# EAGLE schematic NanoBot-REV2 (EAGLE 9.6.2)

## Sheet 1 of 3
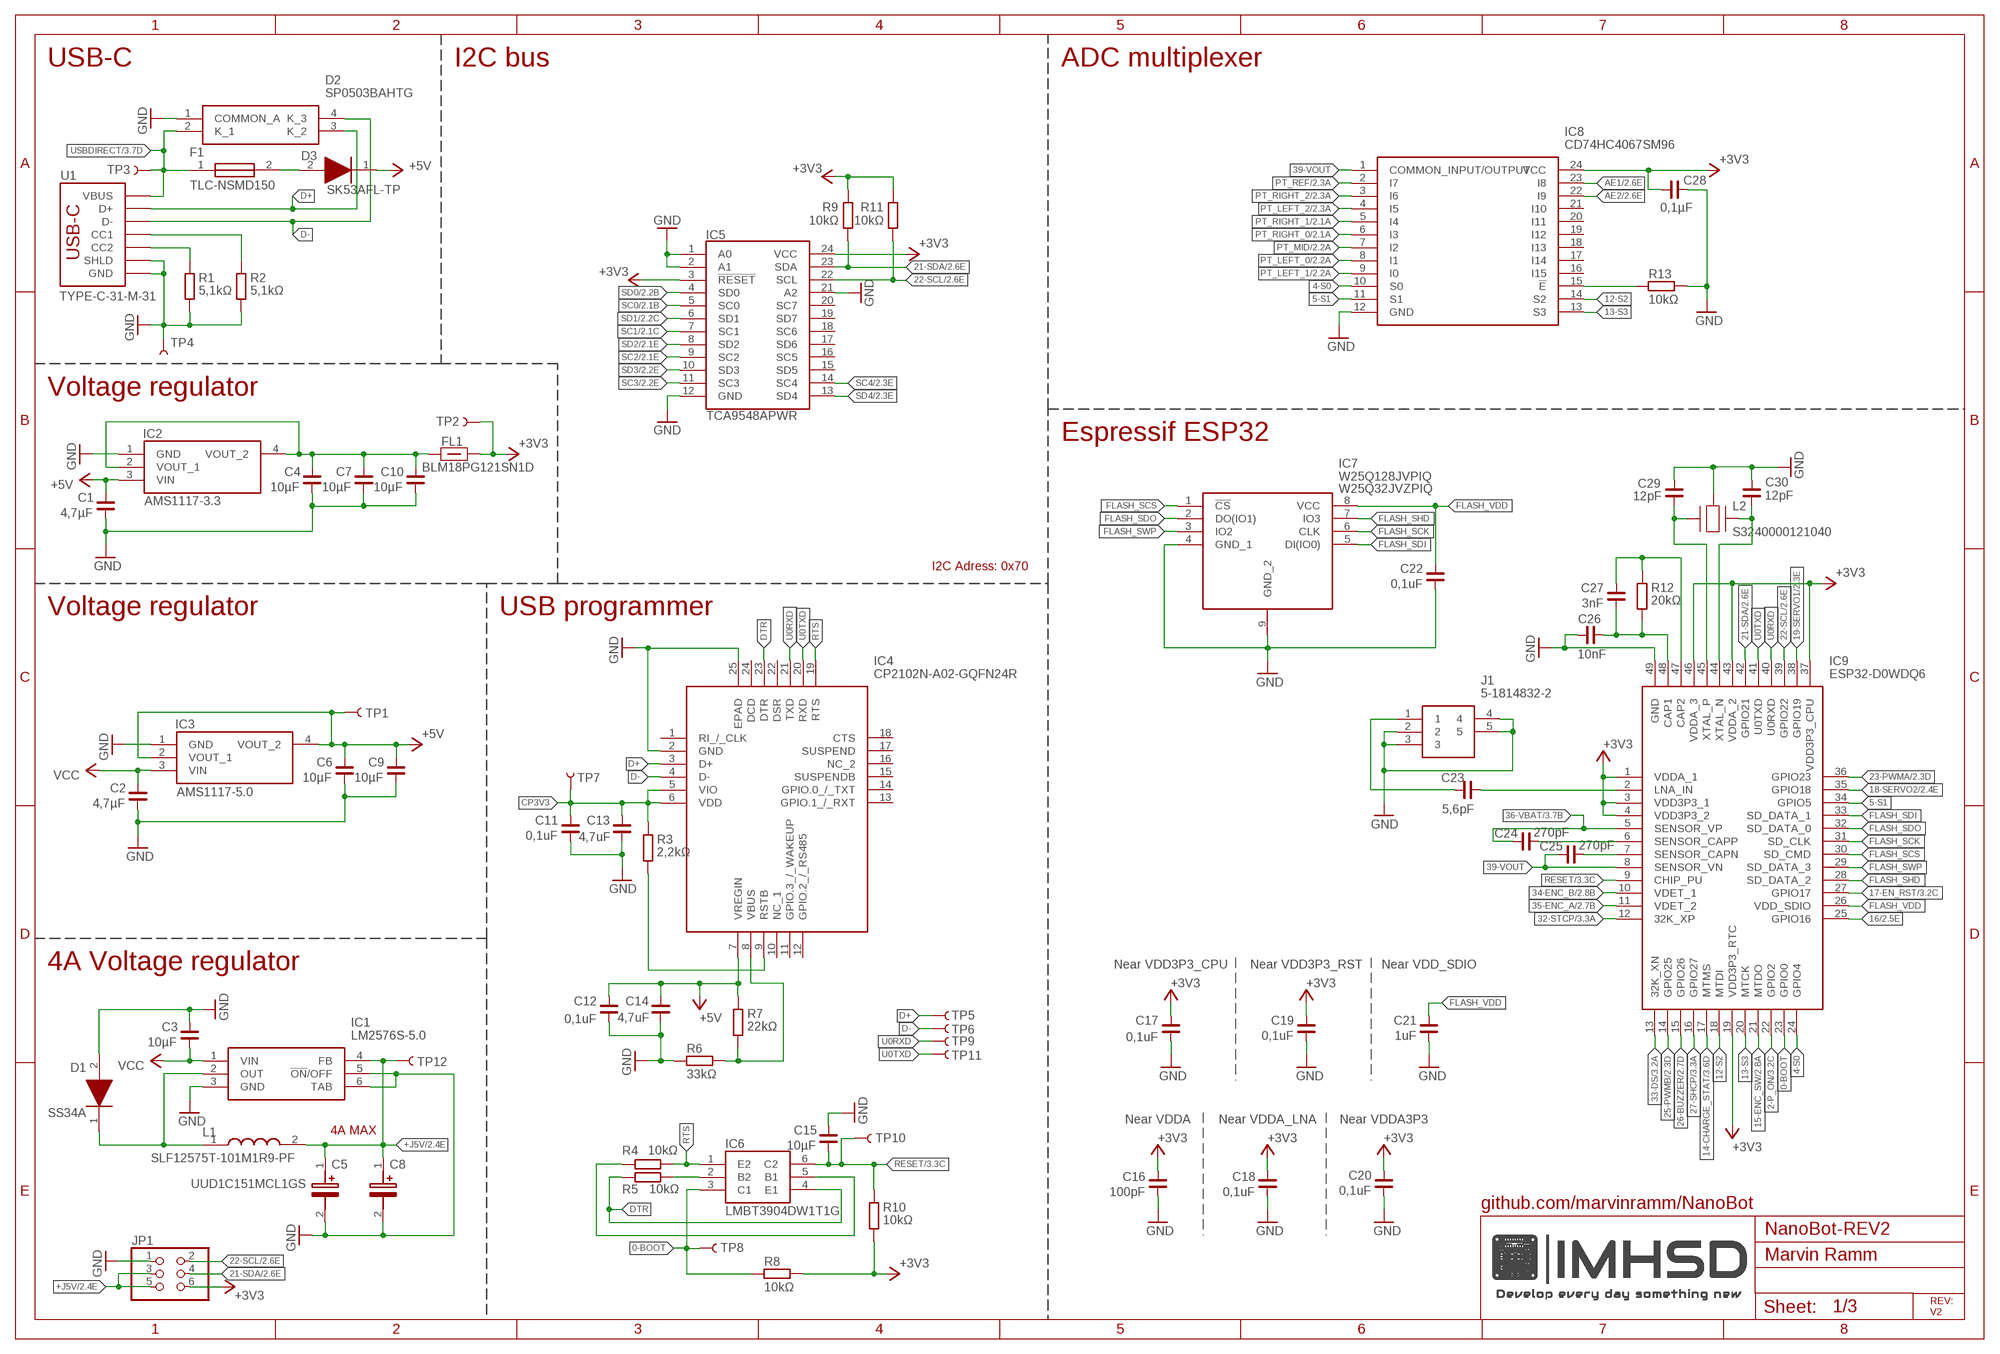
[diagram p0: schematic, sheet 1]

### Parts
C1  4,7µF  C_0603  [C0603]
C2  4,7µF  C_0603  [C0603]
C3  10µF  C_0603  [C0603]
C4  10µF  C_0603  [C0603]
C5  UUD1C151MCL1GS  [CAPAE660X800N]
C6  10µF  C_0603  [C0603]
C7  10µF  C_0603  [C0603]
C8  UUD1C151MCL1GS  [CAPAE660X800N]
C9  10µF  C_0603  [C0603]
C10  10µF  C_0603  [C0603]
C11  0,1uF  C_0402  [C0402]
C12  0,1uF  C_0402  [C0402]
C13  4,7uF  C_0402  [C0402]
C14  4,7uF  C_0402  [C0402]
C15  10µF  C_0603  [C0603]
C16  100pF  C_0402  [C0402]
C17  0,1uF  C_0402  [C0402]
C18  0,1uF  C_0402  [C0402]
C19  0,1uF  C_0402  [C0402]
C20  0,1uF  C_0402  [C0402]
C21  1uF  C_0402  [C0402]
C22  0,1uF  C_0402  [C0402]
C23  5,6pF  C_0402  [C0402]
C24  270pF  C_0402  [C0402]
C25  270pF  C_0402  [C0402]
C26  10nF  C_0402  [C0402]
C27  3nF  C_0402  [C0402]
C28  0,1µF  C_0402  [C0402]
C29  12pF  C_0402  [C0402]
C30  12pF  C_0402  [C0402]
D1  SS34A  [DIOM5026X262N]
D2  SP0503BAHTG  [SP0503BAHTG]
D3  SK53AFL-TP  [SODFL5026X120N]
F1  NANOSMDC020F-2  [FUSC3216X82N]
FL1  BLM18PG121SN1D  [BLM18AG102BH1D]
IC1  LM2576S-5.0  [KTT0005B]
IC2  AMS1117-3.3  [SOT229P700X180-4N]
IC3  AMS1117-3.3  [SOT229P700X180-4N]
IC4  CP2102N-A02-GQFN24R  [QFN50P400X400X80-25N]
IC5  TCA9548APWR  [SOP65P640X120-24N]
IC6  MMDT3904-TP  [SOT65P230X120-6N]
IC7  W25Q128JVPIQ  [SON127P800X600X80-9N]
IC8  CD74HC4067SM96  [SOP65P780X200-24N]
IC9  ESP32-D0WDQ6  [QFN40P600X600X90-49N]
J1  5-1814832-2  [518148322]
JP1  PINHD-2X3  [2X03]
L1  SLF12575T-101M1R9-PF  [SLF12575]
L2  SMD-3225_4P16MHZ_20PF_10PPM_-4  [SMD3225_4P16MHZ20PF10PPM4085]
R1  5,1kΩ  R_0402  [R0402]
R2  5,1kΩ  R_0402  [R0402]
R3  2,2kΩ  R_0402  [R0402]
R4  10kΩ  R_0402  [R0402]
R5  10kΩ  R_0402  [R0402]
R6  33kΩ  R_0402  [R0402]
R7  22kΩ  R_0402  [R0402]
R8  10kΩ  R_0402  [R0402]
R9  10kΩ  R_0402  [R0402]
R10  10kΩ  R_0402  [R0402]
R11  10kΩ  R_0402  [R0402]
R12  20kΩ  R_0402  [R0402]
R13  10kΩ  R_0402  [R0402]
TP1  TEST-POINT3X5  [PAD.03X.05]
TP2  TEST-POINT3X5  [PAD.03X.05]
TP3  TEST-POINT3X5  [PAD.03X.05]
TP4  TEST-POINT3X5  [PAD.03X.05]
TP5  TEST-POINT3X5  [PAD.03X.05]
TP6  TEST-POINT3X5  [PAD.03X.05]
TP7  TEST-POINT3X5  [PAD.03X.05]
TP8  TEST-POINT3X5  [PAD.03X.05]
TP9  TEST-POINT3X5  [PAD.03X.05]
TP10  TEST-POINT3X5  [PAD.03X.05]
TP11  TEST-POINT3X5  [PAD.03X.05]
TP12  TEST-POINT3X5  [PAD.03X.05]
U1  TYPE-C-31-M-14  [TYPE-C-31-M-14_HRO]

### Nets
0-BOOT: IC6.3(C1) IC9.23(GPIO0) R8.2 TP8.1
2-P_ON: IC9.22(GPIO2) ; also sheet 3
4-S0: IC8.10(S0) IC9.24(GPIO4)
5-S1: IC8.11(S1) IC9.34(GPIO5)
12-S2: IC8.14(S2) IC9.18(MTDI)
13-S3: IC8.13(S3) IC9.20(MTCK)
14-CHARGE_STAT: IC9.17(MTMS) ; also sheet 3
15-ENC_SW: IC9.21(MTDO) ; also sheet 2
16: IC9.25(GPIO16) ; also sheet 2
17-EN_RST: IC9.27(GPIO17) ; also sheet 3
18-SERVO2: IC9.35(GPIO18) ; also sheet 2
19-SERVO1: IC9.38(GPIO19) ; also sheet 2
21-SDA: IC5.23(SDA) IC9.42(GPIO21) JP1.4 R9.1 ; also sheet 2
22-SCL: IC5.22(SCL) IC9.39(GPIO22) JP1.2 R11.1 ; also sheet 2
23-PWMA: IC9.36(GPIO23) ; also sheet 2
25-PWMB: IC9.14(GPIO25) ; also sheet 2
26-BUZZER: IC9.15(GPIO26) ; also sheet 2
27-SHCP: IC9.16(GPIO27) ; also sheet 3
32-STCP: IC9.12(32K_XP) ; also sheet 3
33-DS: IC9.13(32K_XN) ; also sheet 3
34-ENC_B: IC9.10(VDET_1) ; also sheet 2
35-ENC_A: IC9.11(VDET_2) ; also sheet 2
36-VBAT: C24.1 IC9.5(SENSOR_VP) ; also sheet 3
39-VOUT: C25.1 IC8.1(COMMON_INPUT/OUTPUT) IC9.8(SENSOR_VN)
+3V3: C16.2 C17.2 C18.2 C19.2 C20.2 C28.1 FL1.1 IC5.3(!RESET) IC5.24(VCC) IC8.24(VCC) IC9.1(VDDA_1) IC9.3(VDD3P3_1) IC9.4(VDD3P3_2) IC9.19(VDD3P3_RTC) IC9.37(VDD3P3_CPU) IC9.43(VDDA_2) IC9.46(VDDA_3) JP1.6 R8.1 R9.2 R10.2 R11.2 TP2.1 ; also sheet 2,3
+5V: C1.1 C6.1 C9.1 C12.2 C14.2 D3.1(K) IC2.3(VIN) IC3.2(VOUT_1) IC3.4(VOUT_2) IC4.7(VREGIN) R7.1 TP1.1 ; also sheet 2,3
+J5V: C5.1(+) C8.1(+) IC1.4(FB) JP1.3 JP1.5 L1.2 TP12.1 ; also sheet 2
AE1: IC8.23(I8) ; also sheet 2
AE2: IC8.22(I9) ; also sheet 2
CP3V3: C11.2 C13.2 IC4.5(VIO) IC4.6(VDD) R3.1 TP7.1
D+: D2.3(K_2) IC4.3(D+) TP5.1 U1.A6(D+) U1.B6(D+)
D-: D2.4(K_3) IC4.4(D-) TP6.1 U1.A7(D-) U1.B7(D-)
DTR: IC4.23(DTR) IC6.4(E1) R5.2
FLASH_SCK: IC7.6(CLK) IC9.31(SD_CLK)
FLASH_SCS: IC7.1(!CS) IC9.30(SD_CMD)
FLASH_SDI: IC7.5(DI(IO0)) IC9.33(SD_DATA_1)
FLASH_SDO: IC7.2(DO(IO1)) IC9.32(SD_DATA_0)
FLASH_SHD: IC7.7(IO3) IC9.28(SD_DATA_2)
FLASH_SWP: IC7.3(IO2) IC9.29(SD_DATA_3)
FLASH_VDD: C21.2 C22.2 IC7.8(VCC) IC9.26(VDD_SDIO)
GND: C1.2 C2.2 C3.1 C4.2 C5.2(-) C6.2 C7.2 C8.2(-) C9.2 C10.2 C11.1 C12.1 C13.1 C14.1 C15.1 C16.1 C17.1 C18.1 C19.1 C20.1 C21.1 C22.1 C26.1 C28.2 C29.1 C30.1 D1.2(A) D2.1(COMMON_A) IC1.3(GND) IC1.5(!ON!/OFF) IC1.6(TAB) IC2.1(GND) IC3.1(GND) IC4.2(GND) IC4.25(EPAD) IC5.1(A0) IC5.2(A1) IC5.12(GND) IC5.21(A2) IC7.4(GND_1) IC7.9(GND_2) IC8.12(GND) IC9.49(GND) J1.2 J1.3 J1.4 J1.5 JP1.1 L2.2(GND_2) L2.4(GND_2) R1.2 R2.2 R6.2 R13.2 TP4.1 U1.A1B12(GND) U1.B1A12(GND) U1.P$1(SHLD) U1.P$2(SHLD) U1.P$3(SHLD) U1.P$4(SHLD) U1.P$5(SHLD) U1.P$6(SHLD) U1.P$7(SHLD) U1.P$8(SHLD) U1.P$9(SHLD) U1.P$10(SHLD) U1.P$11(SHLD) U1.P$12(SHLD) U1.P$14(SHLD) U1.P$16(SHLD) U1.P$18(SHLD) U1.P$20(SHLD) ; also sheet 2,3
N$9: C4.1 C7.1 C10.1 FL1.2 IC2.2(VOUT_1) IC2.4(VOUT_2)
N$10: R1.1 U1.B5(CC2)
N$11: R2.1 U1.A5(CC1)
N$12: IC4.9(RSTB) R3.2
N$13: IC4.8(VBUS) R6.1 R7.2
N$20: IC8.15(!E) R13.1
N$23: C23.1 IC9.2(LNA_IN)
N$24: C26.2 C27.1 IC9.48(CAP1) R12.2
N$25: C27.2 IC9.47(CAP2) R12.1
N$26: C30.2 IC9.44(XTAL_N) L2.3(CRYSTAL_2)
N$27: C29.2 IC9.45(XTAL_P) L2.1(CRYSTAL_1)
N$29: C23.2 J1.1
N$37: IC6.5(B1) R4.2
N$38: IC6.2(B2) R5.1
N$39: C25.2 IC9.7(SENSOR_CAPN)
N$40: D3.2(A) F1.2
N$41: C24.2 IC9.6(SENSOR_CAPP)
N$43: D1.1(K) IC1.2(OUT) L1.1
PT_LEFT_0: IC8.8(I1) ; also sheet 2
PT_LEFT_1: IC8.9(I0) ; also sheet 2
PT_LEFT_2: IC8.4(I5) ; also sheet 2
PT_MID: IC8.7(I2) ; also sheet 2
PT_REF: IC8.2(I7) ; also sheet 2
PT_RIGHT_0: IC8.6(I3) ; also sheet 2
PT_RIGHT_1: IC8.5(I4) ; also sheet 2
PT_RIGHT_2: IC8.3(I6) ; also sheet 2
RESET: C15.2 IC6.6(C2) IC9.9(CHIP_PU) R10.1 TP10.1 ; also sheet 3
RTS: IC4.19(RTS) IC6.1(E2) R4.1
SC0: IC5.5(SC0) ; also sheet 2
SC1: IC5.7(SC1) ; also sheet 2
SC2: IC5.9(SC2) ; also sheet 2
SC3: IC5.11(SC3) ; also sheet 2
SC4: IC5.14(SC4) ; also sheet 2
SD0: IC5.4(SD0) ; also sheet 2
SD1: IC5.6(SD1) ; also sheet 2
SD2: IC5.8(SD2) ; also sheet 2
SD3: IC5.10(SD3) ; also sheet 2
SD4: IC5.13(SD4) ; also sheet 2
U0RXD: IC4.21(TXD) IC9.40(U0RXD) TP9.1
U0TXD: IC4.20(RXD) IC9.41(U0TXD) TP11.1
USBDIRECT: D2.2(K_1) F1.1 TP3.1 U1.A4B9(VBUS) U1.B4A9(VBUS) ; also sheet 3
VCC: C2.1 C3.2 IC1.1(VIN) IC3.3(VIN) ; also sheet 2,3
Unconnected: IC4.1(RI_/_CLK) IC4.10(NC_1) IC4.11(GPIO.3_/_WAKEUP) IC4.12(GPIO.2_/_RS485) IC4.13(GPIO.1_/_RXT) IC4.14(GPIO.0_/_TXT) IC4.15(SUSPENDB) IC4.16(NC_2) IC4.17(SUSPEND) IC4.18(CTS) IC4.22(DSR) IC4.24(DCD) IC5.15(SD5) IC5.16(SC5) IC5.17(SD6) IC5.18(SC6) IC5.19(SD7) IC5.20(SC7) IC8.16(I15) IC8.17(I14) IC8.18(I13) IC8.19(I12) IC8.20(I11) IC8.21(I10)

### Notes on the sheet
- USB-C | I2C bus | ADC multiplexer
- TLC-NSMD150
- TYPE-C-31-M-31
- Voltage regulator
- Espressif ESP32
- W25Q32JVZPIQ
- S3240000121040
- I2C Adress: 0x70
- Voltage regulator | USB programmer
- AMS1117-5.0
- Near VDD3P3_CPU | Near VDD3P3_RST | Near VDD_SDIO
- 4A Voltage regulator
- Near VDDA | Near VDDA_LNA | Near VDDA3P3
- 4A MAX
- LMBT3904DW1T1G | github.com/marvinramm/NanoBot
- Marvin Ramm
- REV:
  V2

## Sheet 2 of 3
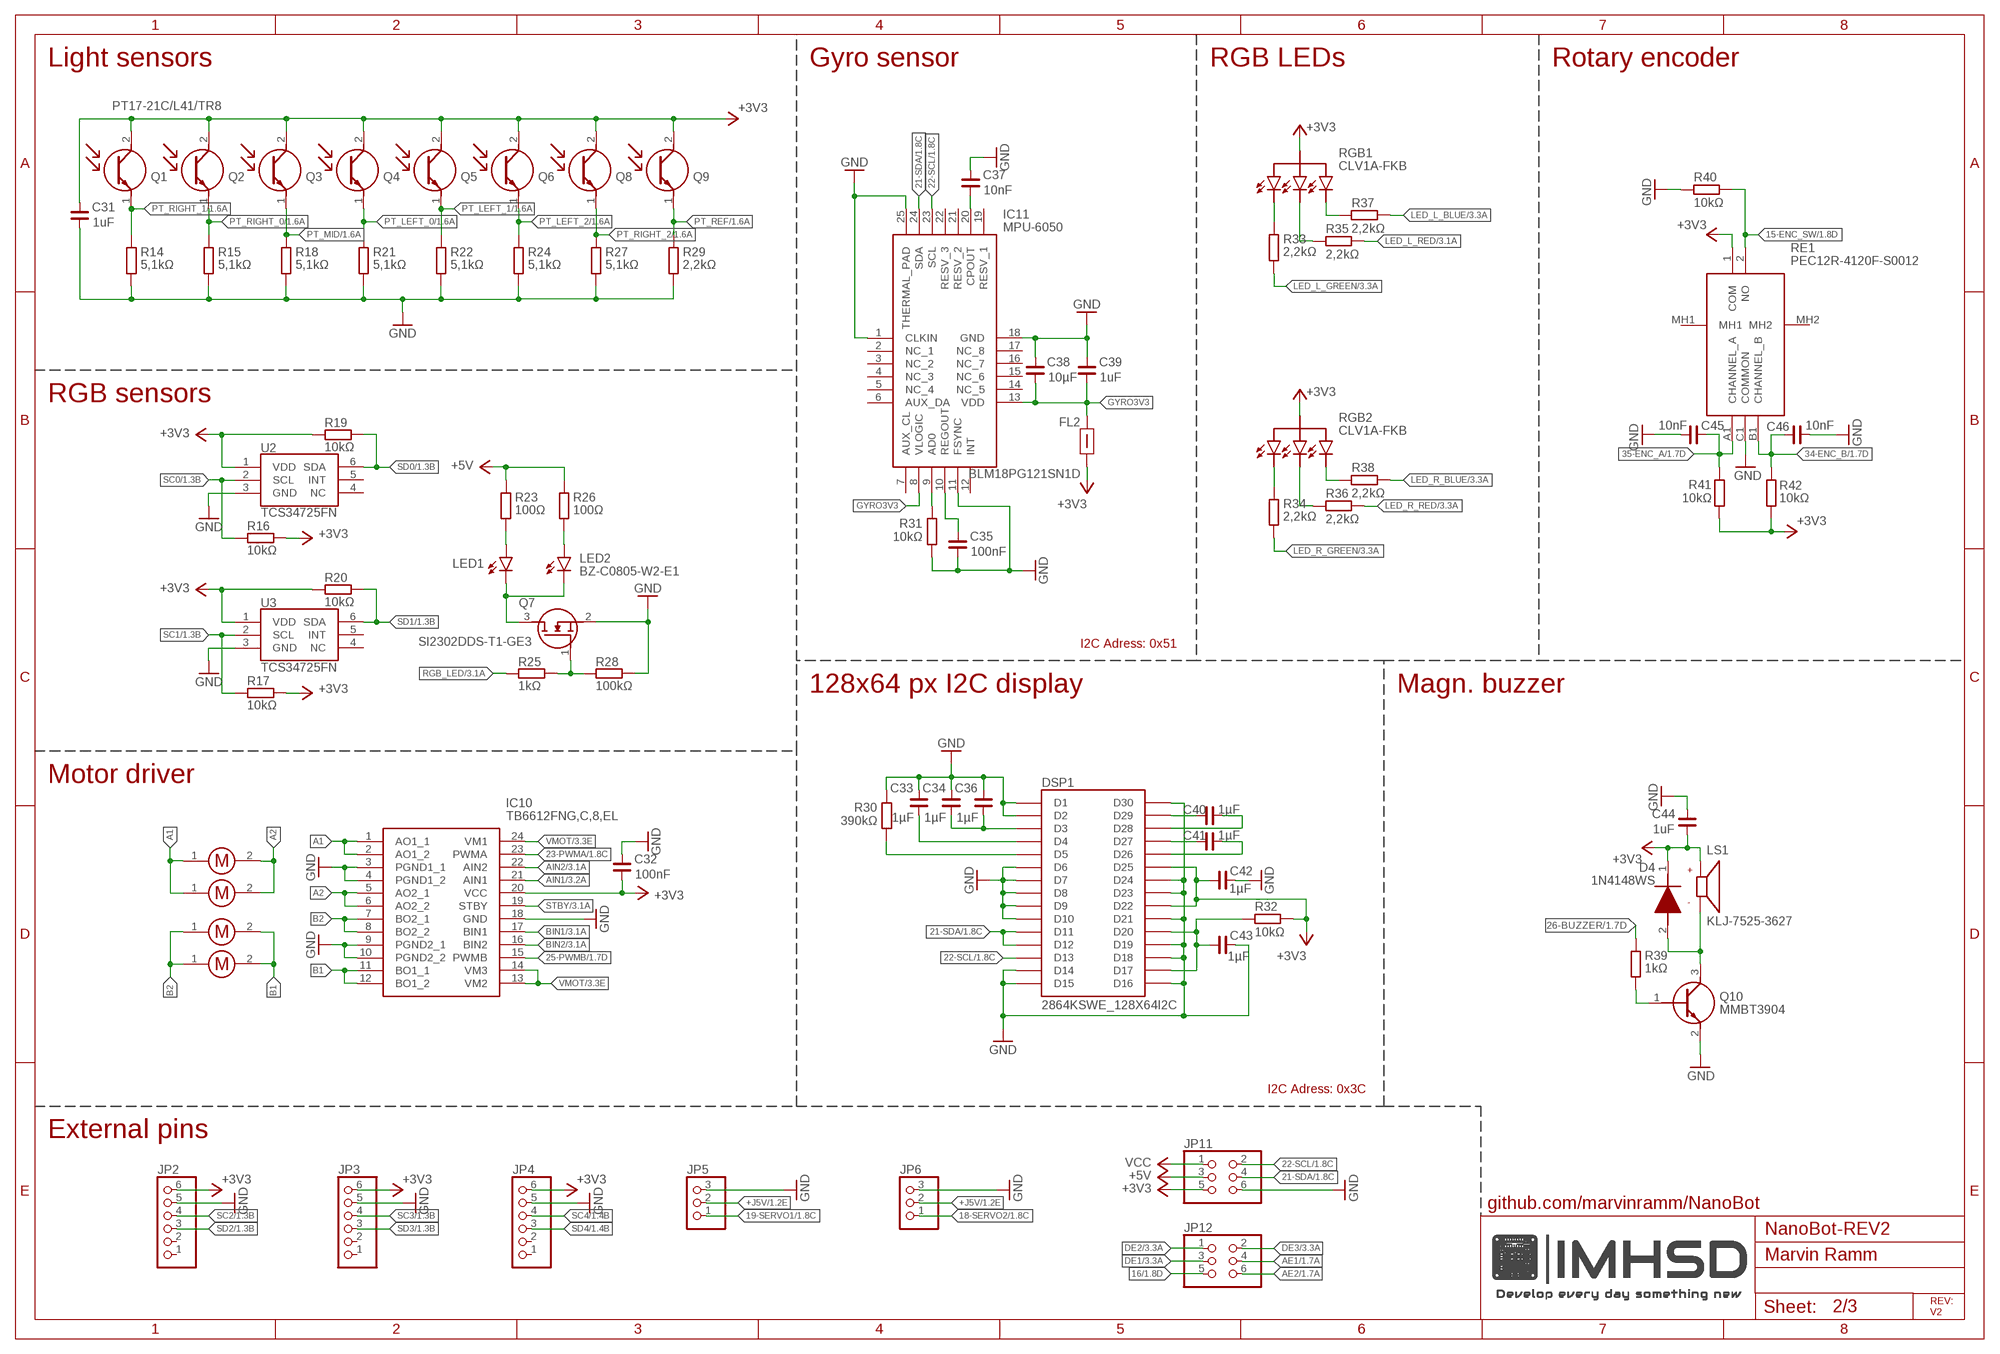
[diagram p1: schematic, sheet 2]

### Parts
C31  1uF  C_0402  [C0402]
C32  100nF  C_0402  [C0402]
C33  1µF  C_0402  [C0402]
C34  1µF  C_0402  [C0402]
C35  100nF  C_0402  [C0402]
C36  1µF  C_0402  [C0402]
C37  10nF  C_0402  [C0402]
C38  10µF  C_0603  [C0603]
C39  1uF  C_0402  [C0402]
C40  1µF  C_0402  [C0402]
C41  1µF  C_0402  [C0402]
C42  1µF  C_0402  [C0402]
C43  1µF  C_0402  [C0402]
C44  1uF  C_0402  [C0402]
C45  10nF  C_0402  [C0402]
C46  10nF  C_0402  [C0402]
D4  1N4148WS  [SODFL2512X90N]
DSP1  2864KSWE_128X64I2C  [2864KSWE_128X64I2C]
FL2  BLM18PG121SN1D  [BLM18AG102BH1D]
IC10  TB6612FNG,C,8,EL  [SOP65P760X160-24N]
IC11  MPU-6050  [QFN50P400X400X95-25N]
JP2  PINHD-1X6  [1X06]
JP3  PINHD-1X6  [1X06]
JP4  PINHD-1X6  [1X06]
JP5  PINHD-1X3  [1X03]
JP6  PINHD-1X3  [1X03]
JP11  PINHD-2X3  [2X03]
JP12  PINHD-2X3  [2X03]
LED1  LEDCHIP-LED0805  [CHIP-LED0805]
LED2  LEDCHIP-LED0805  [CHIP-LED0805]
LS1  CMT-7525-80-SMT-TR  [XDCR_CMT-7525-80-SMT-TR]
M1  MOTOR_30RPM  [MOTOR_30RPM]
M2  MOTOR_30RPM  [MOTOR_30RPM]
M3  MOTOR_30RPM  [MOTOR_30RPM]
M4  MOTOR_30RPM  [MOTOR_30RPM]
Q1  PT17-21C/L41/TR8  [0805]
Q2  PT17-21C/L41/TR8  [0805]
Q3  PT17-21C/L41/TR8  [0805]
Q4  PT17-21C/L41/TR8  [0805]
Q5  PT17-21C/L41/TR8  [0805]
Q6  PT17-21C/L41/TR8  [0805]
Q7  SI2302DDS-T1-GE3  [SOT95P237X112-3N]
Q8  PT17-21C/L41/TR8  [0805]
Q9  PT17-21C/L41/TR8  [0805]
Q10  MMBT3904  [SOT95P240X120-3N]
R14  5,1kΩ  R_0402  [R0402]
R15  5,1kΩ  R_0402  [R0402]
R16  10kΩ  R_0402  [R0402]
R17  10kΩ  R_0402  [R0402]
R18  5,1kΩ  R_0402  [R0402]
R19  10kΩ  R_0402  [R0402]
R20  10kΩ  R_0402  [R0402]
R21  5,1kΩ  R_0402  [R0402]
R22  5,1kΩ  R_0402  [R0402]
R23  100Ω  R_0402  [R0402]
R24  5,1kΩ  R_0402  [R0402]
R25  1kΩ  R_0402  [R0402]
R26  100Ω  R_0402  [R0402]
R27  5,1kΩ  R_0402  [R0402]
R28  100kΩ  R_0402  [R0402]
R29  2,2kΩ  R_0402  [R0402]
R30  390kΩ  R_0402  [R0402]
R31  10kΩ  R_0402  [R0402]
R32  10kΩ  R_0402  [R0402]
R33  2,2kΩ  R_0402  [R0402]
R34  2,2kΩ  R_0402  [R0402]
R35  2,2kΩ  R_0402  [R0402]
R36  2,2kΩ  R_0402  [R0402]
R37  2,2kΩ  R_0402  [R0402]
R38  2,2kΩ  R_0402  [R0402]
R39  1kΩ  R_0402  [R0402]
R40  10kΩ  R_0402  [R0402]
R41  10kΩ  R_0402  [R0402]
R42  10kΩ  R_0402  [R0402]
RE1  PEC12R-4230F-S0024  [PEC12R4230FS0024]
RGB1  RGBLED  [RGBLED]
RGB2  RGBLED  [RGBLED]
U2  TCS34725FN  [FN_1]
U3  TCS34725FN  [FN_1]

### Nets
15-ENC_SW: R40.2 RE1.2(NO) ; also sheet 1
16: JP12.5 ; also sheet 1
18-SERVO2: JP6.1 ; also sheet 1
19-SERVO1: JP5.1 ; also sheet 1
21-SDA: DSP1.D11 DSP1.D12 IC11.24(SDA) JP11.4 ; also sheet 1
22-SCL: DSP1.D13 IC11.23(SCL) JP11.2 ; also sheet 1
23-PWMA: IC10.23(PWMA) ; also sheet 1
25-PWMB: IC10.15(PWMB) ; also sheet 1
26-BUZZER: R39.1 ; also sheet 1
34-ENC_B: C46.1 R42.2 RE1.B1(CHANNEL_B) ; also sheet 1
35-ENC_A: C45.1 R41.2 RE1.A1(CHANNEL_A) ; also sheet 1
+3V3: C31.2 C32.1 C42.1 C44.1 D4.1(K) DSP1.D22 DSP1.D25 FL2.1 IC10.20(VCC) JP2.6 JP3.6 JP4.6 JP11.5 LS1.P Q1.2(C) Q2.2(C) Q3.2(C) Q4.2(C) Q5.2(C) Q6.2(C) Q8.2(C) Q9.2(C) R16.1 R17.1 R19.2 R20.2 R32.2 R41.1 R42.1 RE1.1(COM) RGB1.+5V RGB2.+5V U2.1(VDD) U3.1(VDD) ; also sheet 1,3
+5V: JP11.3 R23.1 R26.1 ; also sheet 1,3
+J5V: JP5.2 JP6.2 ; also sheet 1
A1: IC10.1(AO1_1) IC10.2(AO1_2) M1.1 M2.1
A2: IC10.5(AO2_1) IC10.6(AO2_2) M1.2 M2.2
AE1: JP12.4 ; also sheet 1
AE2: JP12.6 ; also sheet 1
AIN1: IC10.21(AIN1) ; also sheet 3
AIN2: IC10.22(AIN2) ; also sheet 3
B1: IC10.11(BO1_1) IC10.12(BO1_2) M3.2 M4.2
B2: IC10.7(BO2_1) IC10.8(BO2_2) M3.1 M4.1
BIN1: IC10.17(BIN1) ; also sheet 3
BIN2: IC10.16(BIN2) ; also sheet 3
DE1: JP12.3 ; also sheet 3
DE2: JP12.1 ; also sheet 3
DE3: JP12.2 ; also sheet 3
GND: C31.1 C32.2 C33.1 C34.1 C35.1 C36.1 C37.2 C38.1 C39.2 C42.2 C43.2 C44.2 C45.2 C46.2 DSP1.D1 DSP1.D2 DSP1.D6 DSP1.D7 DSP1.D8 DSP1.D9 DSP1.D10 DSP1.D14 DSP1.D15 DSP1.D16 DSP1.D18 DSP1.D19 DSP1.D21 DSP1.D23 DSP1.D24 DSP1.D30 IC10.3(PGND1_1) IC10.4(PGND1_2) IC10.9(PGND2_1) IC10.10(PGND2_2) IC10.18(GND) IC11.1(CLKIN) IC11.11(FSYNC) IC11.18(GND) IC11.25(THERMAL_PAD) JP2.5 JP3.5 JP4.5 JP5.3 JP6.3 JP11.6 Q7.2(S) Q10.2(E) R14.2 R15.2 R18.2 R21.2 R22.2 R24.2 R27.2 R28.2 R29.2 R30.2 R31.1 R40.1 RE1.C1(COMMON) U2.3(GND) U3.3(GND) ; also sheet 1,3
GYRO3V3: C38.2 C39.1 FL2.2 IC11.8(VLOGIC) IC11.13(VDD)
LED_L_BLUE: R37.2 ; also sheet 3
LED_L_GREEN: R33.2 ; also sheet 3
LED_L_RED: R35.2 ; also sheet 3
LED_R_BLUE: R38.2 ; also sheet 3
LED_R_GREEN: R34.2 ; also sheet 3
LED_R_RED: R36.2 ; also sheet 3
N$1: C37.1 IC11.20(CPOUT)
N$2: C35.2 IC11.10(REGOUT)
N$3: IC11.9(AD0) R31.2
N$5: LED1.A R23.2
N$6: LED2.A R26.2
N$7: LED1.C LED2.C Q7.3(D)
N$8: Q7.1(G) R25.2 R28.1
N$28: C41.1 DSP1.D27
N$30: C43.1 DSP1.D17 DSP1.D20 R32.1
N$31: C33.2 DSP1.D4
N$32: C41.2 DSP1.D26
N$33: C34.2 C36.2 DSP1.D3
N$34: DSP1.D5 R30.1
N$35: C40.1 DSP1.D29
N$36: C40.2 DSP1.D28
N$45: R33.1 RGB1.P3
N$46: R37.1 RGB1.P1
N$47: R35.1 RGB1.P2
N$50: R34.1 RGB2.P3
N$51: R38.1 RGB2.P1
N$52: R36.1 RGB2.P2
N$66: D4.2(A) LS1.N Q10.3(C)
N$69: Q10.1(B) R39.2
PT_LEFT_0: Q4.1(E) R21.1 ; also sheet 1
PT_LEFT_1: Q5.1(E) R22.1 ; also sheet 1
PT_LEFT_2: Q6.1(E) R24.1 ; also sheet 1
PT_MID: Q3.1(E) R18.1 ; also sheet 1
PT_REF: Q9.1(E) R29.1 ; also sheet 1
PT_RIGHT_0: Q2.1(E) R15.1 ; also sheet 1
PT_RIGHT_1: Q1.1(E) R14.1 ; also sheet 1
PT_RIGHT_2: Q8.1(E) R27.1 ; also sheet 1
RGB_LED: R25.1 ; also sheet 3
SC0: R16.2 U2.2(SCL) ; also sheet 1
SC1: R17.2 U3.2(SCL) ; also sheet 1
SC2: JP2.4 ; also sheet 1
SC3: JP3.4 ; also sheet 1
SC4: JP4.4 ; also sheet 1
SD0: R19.1 U2.6(SDA) ; also sheet 1
SD1: R20.1 U3.6(SDA) ; also sheet 1
SD2: JP2.3 ; also sheet 1
SD3: JP3.3 ; also sheet 1
SD4: JP4.3 ; also sheet 1
STBY: IC10.19(STBY) ; also sheet 3
VCC: JP11.1 ; also sheet 1,3
VMOT: IC10.13(VM2) IC10.14(VM3) IC10.24(VM1) ; also sheet 3
Unconnected: IC11.2(NC_1) IC11.3(NC_2) IC11.4(NC_3) IC11.5(NC_4) IC11.6(AUX_DA) IC11.7(AUX_CL) IC11.12(INT) IC11.14(NC_5) IC11.15(NC_6) IC11.16(NC_7) IC11.17(NC_8) IC11.19(RESV_1) IC11.21(RESV_2) IC11.22(RESV_3) JP2.1 JP2.2 JP3.1 JP3.2 JP4.1 JP4.2 RE1.MH1 RE1.MH2 U2.4(NC) U2.5(INT) U3.4(NC) U3.5(INT)

### Notes on the sheet
- Light sensors | Gyro sensor | RGB LEDs | Rotary encoder
- RGB1
- CLV1A-FKB
- PEC12R-4120F-S0012
- RGB sensors
- RGB2
- CLV1A-FKB
- BZ-C0805-W2-E1
- I2C Adress: 0x51
- 128x64 px I2C display | Magn. buzzer
- Motor driver
- KLJ-7525-3627
- I2C Adress: 0x3C
- External pins
- github.com/marvinramm/NanoBot
- JP12
- Marvin Ramm
- REV:
  V2

## Sheet 3 of 3
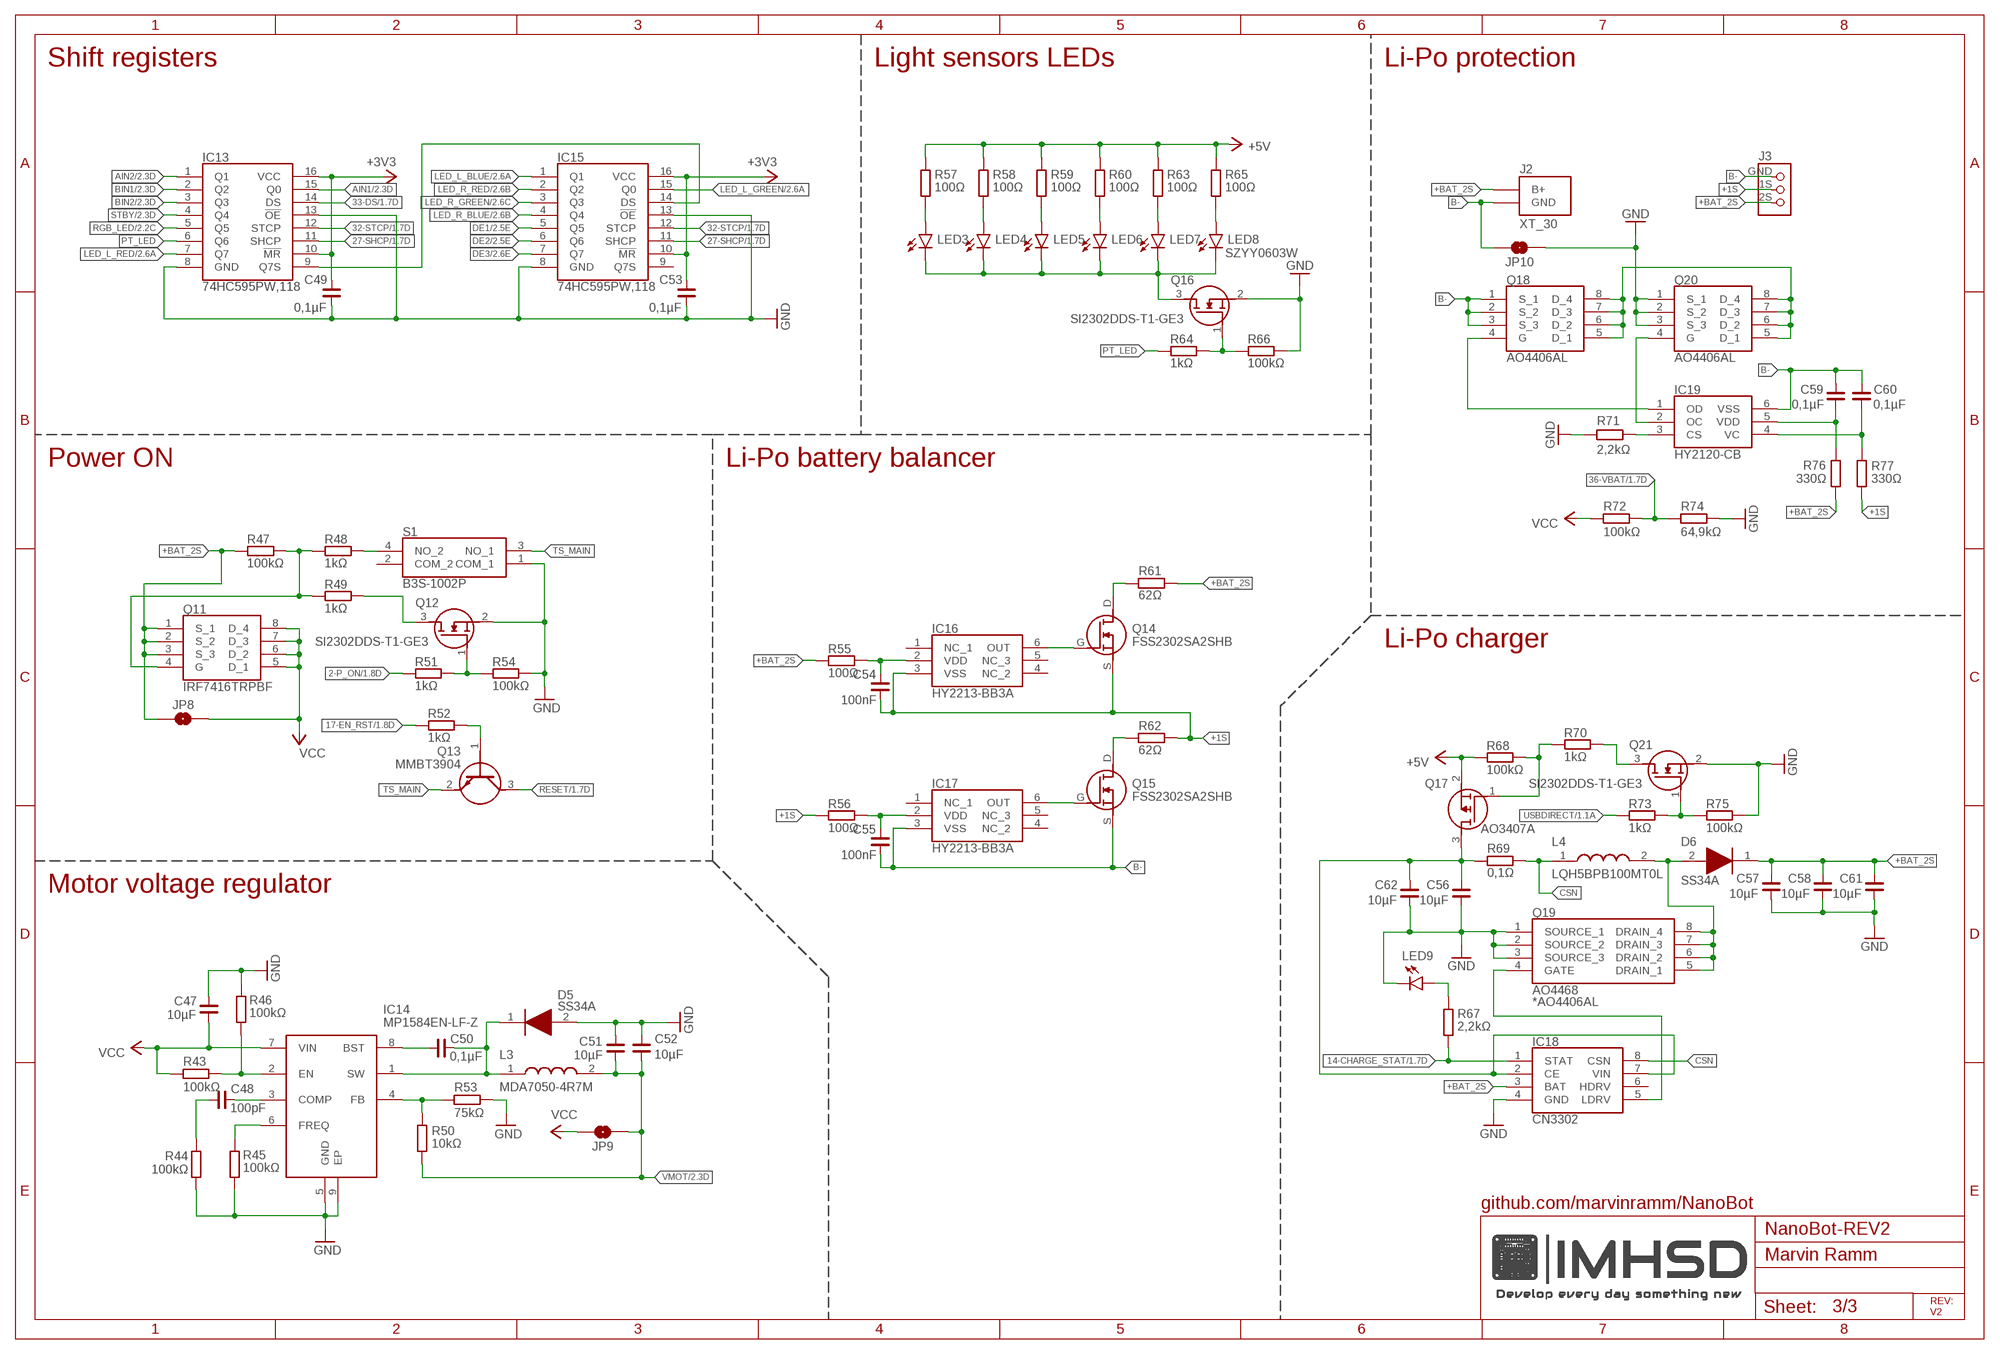
[diagram p2: schematic, sheet 3]

### Parts
C47  10µF  C_0603  [C0603]
C48  100pF  C_0402  [C0402]
C49  0,1µF  C_0402  [C0402]
C50  0,1µF  C_0402  [C0402]
C51  10µF  C_0603  [C0603]
C52  10µF  C_0603  [C0603]
C53  0,1µF  C_0402  [C0402]
C54  100nF  C_0402  [C0402]
C55  100nF  C_0402  [C0402]
C56  10µF  C_0603  [C0603]
C57  10µF  C_0603  [C0603]
C58  10µF  C_0603  [C0603]
C59  0,1µF  C_0402  [C0402]
C60  0,1µF  C_0402  [C0402]
C61  10µF  C_0603  [C0603]
C62  10µF  C_0603  [C0603]
D5  SS34A  [DIOM5026X262N]
D6  SS34A  [DIOM5026X262N]
IC13  74HC595PW,118  [SOP65P640X110-16N]
IC14  MP1584EN-LF-Z  [SOIC127P600X170-9N]
IC15  74HC595PW,118  [SOP65P640X110-16N]
IC16  HY2213-BB3A  [SOT95P280X140-6N]
IC17  HY2213-BB3A  [SOT95P280X140-6N]
IC18  CN3302  [CN3302]
IC19  HY2120-CB  [SOT95P280X140-6N]
J2  XT_30  [XT_30]
J3  2SBALANCER  [2SBALANCER]
JP8  JUMPER-SMT_2_NO_SILK  [SMT-JUMPER_2_NO_SILK]
JP9  JUMPER-SMT_2_NO_SILK  [SMT-JUMPER_2_NO_SILK]
JP10  JUMPER-SMT_2_NO_SILK  [SMT-JUMPER_2_NO_SILK]
L3  MDA7050-4R7M  [MDA7050-4R7M]
L4  LQH5BPB100MT0L  [LQH5BPB100MT0L]
LED3  SZYY0603W  LEDCHIP-LED0603  [CHIP-LED0603]
LED4  SZYY0603W  LEDCHIP-LED0603  [CHIP-LED0603]
LED5  SZYY0603W  LEDCHIP-LED0603  [CHIP-LED0603]
LED6  SZYY0603W  LEDCHIP-LED0603  [CHIP-LED0603]
LED7  SZYY0603W  LEDCHIP-LED0603  [CHIP-LED0603]
LED8  SZYY0603W  LEDCHIP-LED0603  [CHIP-LED0603]
LED9  SZYY0603W  LEDCHIP-LED0603  [CHIP-LED0603]
Q11  IRF7416TRPBF  [SOIC127P600X175-8N]
Q12  SI2302DDS-T1-GE3  [SOT95P237X112-3N]
Q13  MMBT3904  [SOT95P240X120-3N]
Q14  FSS2302SA2SHB  [FSS2302SA2SHB]
Q15  FSS2302SA2SHB  [FSS2302SA2SHB]
Q16  SI2302DDS-T1-GE3  [SOT95P237X112-3N]
Q17  AO3407A  [SOT95P280X125-3N]
Q18  AO4406AL  [SOIC127P600X175-8N]
Q19  AO4468  [SOIC127P600X175-8N]
Q20  AO4406AL  [SOIC127P600X175-8N]
Q21  SI2302DDS-T1-GE3  [SOT95P237X112-3N]
R43  100kΩ  R_0402  [R0402]
R44  100kΩ  R_0402  [R0402]
R45  100kΩ  R_0402  [R0402]
R46  100kΩ  R_0402  [R0402]
R47  100kΩ  R_0402  [R0402]
R48  1kΩ  R_0402  [R0402]
R49  1kΩ  R_0402  [R0402]
R50  10kΩ  R_0402  [R0402]
R51  1kΩ  R_0402  [R0402]
R52  1kΩ  R_0402  [R0402]
R53  75kΩ  R_0402  [R0402]
R54  100kΩ  R_0402  [R0402]
R55  100Ω  R_0402  [R0402]
R56  100Ω  R_0402  [R0402]
R57  100Ω  R_0402  [R0402]
R58  100Ω  R_0402  [R0402]
R59  100Ω  R_0402  [R0402]
R60  100Ω  R_0402  [R0402]
R61  62Ω  R_2512  [R2512]
R62  62Ω  R_2512  [R2512]
R63  100Ω  R_0402  [R0402]
R64  1kΩ  R_0402  [R0402]
R65  100Ω  R_0402  [R0402]
R66  100kΩ  R_0402  [R0402]
R67  2,2kΩ  R_0402  [R0402]
R68  100kΩ  R_0402  [R0402]
R69  0,1Ω  R_2512  [R2512]
R70  1kΩ  R_0402  [R0402]
R71  2,2kΩ  R_0402  [R0402]
R72  100kΩ  R_0402  [R0402]
R73  1kΩ  R_0402  [R0402]
R74  64,9kΩ  R_0402  [R0402]
R75  100kΩ  R_0402  [R0402]
R76  330Ω  R_0402  [R0402]
R77  330Ω  R_0402  [R0402]
S1  B3S-1002P  [B3S1002P]

### Nets
2-P_ON: R51.1 ; also sheet 1
14-CHARGE_STAT: IC18.1(STAT) R67.2 ; also sheet 1
17-EN_RST: R52.1 ; also sheet 1
27-SHCP: IC13.11(SHCP) IC15.11(SHCP) ; also sheet 1
32-STCP: IC13.12(STCP) IC15.12(STCP) ; also sheet 1
33-DS: IC13.14(DS) ; also sheet 1
36-VBAT: R72.2 R74.1 ; also sheet 1
+1S: C54.2 IC16.3(VSS) J3.1S Q14.S R56.1 R62.2 R77.2
+3V3: C49.1 C53.1 IC13.10(!MR) IC13.16(VCC) IC15.10(!MR) IC15.16(VCC) ; also sheet 1,2
+5V: Q17.2(S) R57.1 R58.1 R59.1 R60.1 R63.1 R65.1 R68.1 ; also sheet 1,2
+BAT_2S: C57.1 C58.1 C61.1 D6.1(K) IC18.3(BAT) J2.B+ J3.2S JP8.1 Q11.1(S_1) Q11.2(S_2) Q11.3(S_3) R47.1 R55.1 R61.2 R76.1
AIN1: IC13.15(Q0) ; also sheet 2
AIN2: IC13.1(Q1) ; also sheet 2
B-: C55.2 C59.2 C60.2 IC17.3(VSS) IC19.6(VSS) J2.GND J3.GND JP10.2 Q15.S Q18.1(S_1) Q18.2(S_2) Q18.3(S_3)
BIN1: IC13.2(Q2) ; also sheet 2
BIN2: IC13.3(Q3) ; also sheet 2
CSN: IC18.8(CSN) L4.1 R69.2
DE1: IC15.5(Q5) ; also sheet 2
DE2: IC15.6(Q6) ; also sheet 2
DE3: IC15.7(Q7) ; also sheet 2
GND: C47.1 C49.2 C51.1 C52.1 C53.2 C56.2 C57.2 C58.2 C61.2 C62.2 D5.2(A) IC13.8(GND) IC13.13(!OE) IC14.5(GND) IC14.9(EP) IC15.8(GND) IC15.13(!OE) IC18.4(GND) JP10.1 LED9.C Q12.2(S) Q16.2(S) Q19.1(SOURCE_1) Q19.2(SOURCE_2) Q19.3(SOURCE_3) Q20.1(S_1) Q20.2(S_2) Q20.3(S_3) Q21.2(S) R44.2 R45.2 R46.1 R53.1 R54.2 R66.2 R71.2 R74.2 R75.2 S1.1(COM_1) ; also sheet 1,2
LED_L_BLUE: IC15.1(Q1) ; also sheet 2
LED_L_GREEN: IC15.15(Q0) ; also sheet 2
LED_L_RED: IC13.7(Q7) ; also sheet 2
LED_R_BLUE: IC15.4(Q4) ; also sheet 2
LED_R_GREEN: IC15.3(Q3) ; also sheet 2
LED_R_RED: IC15.2(Q2) ; also sheet 2
N$14: LED7.A R63.2
N$15: LED8.A R65.2
N$16: LED3.C LED4.C LED5.C LED6.C LED7.C LED8.C Q16.3(D)
N$17: Q16.1(G) R64.2 R66.1
N$18: LED6.A R60.2
N$19: IC14.2(EN) R43.1 R46.2
N$21: IC14.6(FREQ) R45.1
N$22: C48.2 IC14.3(COMP)
N$42: C48.1 R44.1
N$44: C50.2 D5.1(K) IC14.1(SW) L3.1
N$48: C50.1 IC14.8(BST)
N$49: IC13.9(Q7S) IC15.14(DS)
N$53: LED5.A R59.2
N$54: LED4.A R58.2
N$55: LED3.A R57.2
N$56: R48.2 S1.4(NO_2)
N$57: Q11.4(G) R47.2 R48.1 R49.1
N$58: Q18.5(D_1) Q18.6(D_2) Q18.7(D_3) Q18.8(D_4) Q20.5(D_1) Q20.6(D_2) Q20.7(D_3) Q20.8(D_4)
N$59: Q12.3(D) R49.2
N$60: Q12.1(G) R51.2 R54.1
N$61: IC19.1(OD) Q18.4(G)
N$62: IC19.2(OC) Q20.4(G)
N$63: IC19.3(CS) R71.1
N$64: C59.1 IC19.5(VDD) R76.2
N$65: C60.1 IC19.4(VC) R77.1
N$67: Q15.D R62.1
N$68: IC17.6(OUT) Q15.G
N$70: C55.1 IC17.2(VDD) R56.2
N$71: Q14.D R61.1
N$72: IC16.6(OUT) Q14.G
N$73: C54.1 IC16.2(VDD) R55.2
N$74: C56.1 C62.1 IC18.2(CE) IC18.7(VIN) Q17.3(D) R69.1
N$75: LED9.A R67.1
N$76: D6.2(A) L4.2 Q19.5(DRAIN_1) Q19.6(DRAIN_2) Q19.7(DRAIN_3) Q19.8(DRAIN_4)
N$77: Q17.1(G) R68.2 R70.1
N$78: IC18.5(LDRV) Q19.4(GATE)
N$79: Q13.1(B) R52.2
N$80: Q21.3(D) R70.2
N$81: Q21.1(G) R73.2 R75.1
N$87: IC14.4(FB) R50.1 R53.2
PT_LED: IC13.6(Q6) R64.1
RESET: Q13.3(C) ; also sheet 1
RGB_LED: IC13.5(Q5) ; also sheet 2
STBY: IC13.4(Q4) ; also sheet 2
TS_MAIN: Q13.2(E) S1.3(NO_1)
USBDIRECT: R73.1 ; also sheet 1
VCC: C47.2 IC14.7(VIN) JP8.2 JP9.2 Q11.5(D_1) Q11.6(D_2) Q11.7(D_3) Q11.8(D_4) R43.2 R72.1 ; also sheet 1,2
VMOT: C51.2 C52.2 JP9.1 L3.2 R50.2 ; also sheet 2
Unconnected: IC15.9(Q7S) IC16.1(NC_1) IC16.4(NC_2) IC16.5(NC_3) IC17.1(NC_1) IC17.4(NC_2) IC17.5(NC_3) IC18.6(HDRV) S1.2(COM_2)

### Notes on the sheet
- Shift registers | Light sensors LEDs | Li-Po protection
- Power ON | Li-Po battery balancer
- Li-Po charger
- Motor voltage regulator
- *AO4406AL
- github.com/marvinramm/NanoBot
- Marvin Ramm
- REV:
  V2

## Library data of the parts
C1-C4 C6 C7 C9-C62 = rc-master-smd:C_: NON-POLARIZED CAP
C5 C8 = UUD1C151MCL1GS:UUD1C151MCL1GS: Cap Aluminum Lytic 150uF 16V 20% (6.3 X 7.7mm) SMD 280mA 2000h 105C Automotive T/R Source: Datasheet <https://datasheet.datasheetarchive.com/originals/dk/DKDS-9/176751.pdf>; ARROW_PART_NUMBER: UUD1C151MCL1GS; ARROW_PRICE-STOCK: https://www.arrow.com/en/products/uud1c151mcl1gs/nichicon; DESCRIPTION: Cap Aluminum Lytic 150uF 16V 20% (6.3 X 7.7mm) SMD 280mA 2000h 105C Automotive T/R; HEIGHT: 8mm; MANUFACTURER_NAME: Nichicon; MANUFACTURER_PART_NUMBER: UUD1C151MCL1GS; MOUSER_PART_NUMBER: 647-UUD1C151MCL; MOUSER_PRICE-STOCK: https://www.mouser.com/Search/Refine.aspx?Keyword=647-UUD1C151MCL
D1 D5 D6 = SS34A:SS34A: MULTICOMP - SS34A - DIODE, RECTIFIER, 3A, 40V, DO-214AC Source: Datasheet <https://componentsearchengine.com/Datasheets/2/SS34A.pdf>; DESCRIPTION: MULTICOMP - SS34A - DIODE, RECTIFIER, 3A, 40V, DO-214AC; HEIGHT: 2.62mm; MANUFACTURER_NAME: MULTICOMP; MANUFACTURER_PART_NUMBER: SS34A
D2 = SP0503BAHTG:SP0503BAHTG: ESD Suppressors / TVS Diodes TVS AVAL DIODE SMT Source: Datasheet <https://nl.mouser.com/datasheet/2/240/Littelfuse_TVS_Diode_Array_SP05_Datasheet.pdf-777043.pdf>; ARROW_PART_NUMBER: SP0503BAHTG; ARROW_PRICE-STOCK: https://www.arrow.com/en/products/sp0503bahtg/littelfuse?region=nac; DESCRIPTION: ESD Suppressors / TVS Diodes TVS AVAL DIODE SMT; HEIGHT: 1.22mm; MANUFACTURER_NAME: LITTELFUSE; MANUFACTURER_PART_NUMBER: SP0503BAHTG; MOUSER_PART_NUMBER: 576-SP0503BAHTG; MOUSER_PRICE-STOCK: https://www.mouser.co.uk/ProductDetail/Littelfuse/SP0503BAHTG?qs=uD%2FdkN7XIa0NTYXwHdELYA%3D%3D
D3 = SK53AFL-TP:SK53AFL-TP: Schottky Diodes & Rectifiers 5A 30Vr 21Vrms 30V 100A Ifsm .55Vf Source: Datasheet <https://componentsearchengine.com/Datasheets/1/SK53AFL-TP.pdf>; ARROW_PART_NUMBER: SK53AFL-TP; ARROW_PRICE-STOCK: https://www.arrow.com/en/products/sk53afl-tp/micro-commercial-components?region=nac; DESCRIPTION: Schottky Diodes & Rectifiers 5A 30Vr 21Vrms 30V 100A Ifsm .55Vf; HEIGHT: 1.2mm; MANUFACTURER_NAME: Micro Commercial Components (MCC); MANUFACTURER_PART_NUMBER: SK53AFL-TP; MOUSER_PART_NUMBER: 833-SK53AFL-TP; MOUSER_PRICE-STOCK: https://www.mouser.co.uk/ProductDetail/Micro-Commercial-Components-MCC/SK53AFL-TP?qs=T3oQrply3y%2F%2FTb8lb%252B6EMA%3D%3D
D4 = 1N4148WS:1N4148WS: ON Semiconductor Switching Diode, 300mA 75V, 2-Pin SOD-323 1N4148WS Source: Datasheet; ARROW_PART_NUMBER: 1N4148WS; ARROW_PRICE-STOCK: https://www.arrow.com/en/products/1n4148ws/on-semiconductor?region=asia; DESCRIPTION: ON Semiconductor Switching Diode, 300mA 75V, 2-Pin SOD-323 1N4148WS; HEIGHT: 0.9mm; MANUFACTURER_NAME: onsemi; MANUFACTURER_PART_NUMBER: 1N4148WS; MOUSER_PART_NUMBER: 512-1N4148WS; MOUSER_PRICE-STOCK: https://www.mouser.co.uk/ProductDetail/ON-Semiconductor-Fairchild/1N4148WS?qs=2%2FYqgE%252BHg%252BKBrKZlAsMLhw%3D%3D
DSP1 = 2864KSWE_128X64I2C:2864KSWE_128X64I2C
F1 = NANOSMDC020F-2:NANOSMDC020F-2: LITTELFUSE - NANOSMDC020F-2 - POLYSWITCH, SMD, 1206, 0.2A Source: Datasheet <https://www.littelfuse.com/~/media/electronics/product_specifications/resettable_ptcs/littelfuse_ptc_nanosmdc020f_2_product_specification.pdf.pdf>; ARROW_PART_NUMBER: NANOSMDC020F-2; ARROW_PRICE-STOCK: https://www.arrow.com/en/products/nanosmdc020f-2/littelfuse; DESCRIPTION: LITTELFUSE - NANOSMDC020F-2 - POLYSWITCH, SMD, 1206, 0.2A; HEIGHT: 0.82mm; MANUFACTURER_NAME: LITTELFUSE; MANUFACTURER_PART_NUMBER: NANOSMDC020F-2; MOUSER_PART_NUMBER: 650-NANOSMDC020F-2; MOUSER_PRICE-STOCK: https://www.mouser.co.uk/ProductDetail/Littelfuse/NANOSMDC020F-2?qs=iK0evp%252BCRRU6agwMt7HYjg%3D%3D
FL1 FL2 = BLM18PG121SN1D:BLM18PG121SN1D: Ferrite bead SMD 0603 120R 2A Murata Ferrite Bead (Chip Ferrite Bead), 1.6 x 0.8 x 0.8mm (0603), 120 impedance at 100 MHz Source: Datasheet <https://www.murata.com/en-us/products/productdetail?partno=BLM18PG121SN1#>; ARROW_PART_NUMBER: BLM18PG121SN1D; ARROW_PRICE-STOCK: https://www.arrow.com/en/products/blm18pg121sn1d/murata-manufacturing?region=nac; DESCRIPTION: Ferrite bead SMD 0603 120R 2A Murata Ferrite Bead (Chip Ferrite Bead), 1.6 x 0.8 x 0.8mm (0603), 120 impedance at 100 MHz; HEIGHT: 0.95mm; MANUFACTURER_NAME: Murata Electronics; MANUFACTURER_PART_NUMBER: BLM18PG121SN1D; MOUSER_PART_NUMBER: 81-BLM18PG121SN1D; MOUSER_PRICE-STOCK: https://www.mouser.co.uk/ProductDetail/Murata-Electronics/BLM18PG121SN1D?qs=tY8e8KZalarVxhnmnUYZ1A%3D%3D
IC1 = LM2576S-5.0:LM2576S-5.0: Stepdown switching regulator,LM2576S-5.0 Source: Datasheet <http://www.ti.com/general/docs/suppproductinfo.tsp?distId=10&gotoUrl=http://www.ti.com/lit/gpn/lm2576hv>; ARROW_PART_NUMBER: LM2576S-5.0; ARROW_PRICE-STOCK: https://www.arrow.com/en/products/lm2576s-5.0/texas-instruments?region=nac; DESCRIPTION: Stepdown switching regulator,LM2576S-5.0; HEIGHT: mm; MANUFACTURER_NAME: Texas Instruments; MANUFACTURER_PART_NUMBER: LM2576S-5.0; MOUSER_PART_NUMBER: 926-LM2576S-50; MOUSER_PRICE-STOCK: https://www.mouser.co.uk/ProductDetail/Texas-Instruments/LM2576S-5.0?qs=X1J7HmVL2ZEPqdmn2TSKwg%3D%3D
IC2 IC3 = AMS1117-3.3:AMS1117-3.3: 1A LOW DROPOUT VOLTAGE REGULATOR, SOT-223 Source: Datasheet <http://www.advanced-monolithic.com/pdf/ds1117.pdf>; ARROW_PART_NUMBER: AMS1117-3.3; DESCRIPTION: 1A LOW DROPOUT VOLTAGE REGULATOR, SOT-223; HEIGHT: 1.8mm; MANUFACTURER_NAME: Advanced Monolithic Systems; MANUFACTURER_PART_NUMBER: AMS1117-3.3
IC4 = CP2102N-A02-GQFN24R:CP2102N-A02-GQFN24R: USB Interface IC USB to UART bridge - QFN24 Source: Datasheet <https://www.silabs.com/documents/public/data-sheets/cp2102n-datasheet.pdf>; ARROW_PART_NUMBER: CP2102N-A02-GQFN24R; ARROW_PRICE-STOCK: https://www.arrow.com/en/products/cp2102n-a02-gqfn24r/silicon-labs; DESCRIPTION: USB Interface IC USB to UART bridge - QFN24; HEIGHT: 0.8mm; MANUFACTURER_NAME: Silicon Labs; MANUFACTURER_PART_NUMBER: CP2102N-A02-GQFN24R; MOUSER_PART_NUMBER: 634-CP2102NA02QFN24R; MOUSER_PRICE-STOCK: https://www.mouser.co.uk/ProductDetail/Silicon-Labs/CP2102N-A02-GQFN24R?qs=u16ybLDytRaIVBf0X4zL0g%3D%3D; SPICEPREFIX: X
IC5 = TCA9548APWR:TCA9548APWR: TEXAS INSTRUMENTS - TCA9548APWR - I2C SWITCH W/ RESET, 8-CH, TSSOP-24 Source: Datasheet <http://www.ti.com/lit/ds/symlink/tca9548a.pdf>; ARROW_PART_NUMBER: TCA9548APWR; ARROW_PRICE-STOCK: https://www.arrow.com/en/products/tca9548apwr/texas-instruments?region=nac; DESCRIPTION: TEXAS INSTRUMENTS - TCA9548APWR - I2C SWITCH W/ RESET, 8-CH, TSSOP-24; HEIGHT: 1.2mm; MANUFACTURER_NAME: Texas Instruments; MANUFACTURER_PART_NUMBER: TCA9548APWR; MOUSER_PART_NUMBER: 595-TCA9548APWR; MOUSER_PRICE-STOCK: https://www.mouser.co.uk/ProductDetail/Texas-Instruments/TCA9548APWR?qs=iFaFN7AS2WF%252BqSiJMbdYwQ%3D%3D
IC6 = MMDT3904-TP:MMDT3904-TP: Bipolar Transistors - BJT 200mA 40V Source: Datasheet <https://datasheet.datasheetarchive.com/originals/distributors/Datasheets_SAMA/783ffc00a4fcd19f10372299d3475a96.pdf>; ARROW_PART_NUMBER: MMDT3904-TP; ARROW_PRICE-STOCK: https://www.arrow.com/en/products/mmdt3904-tp/micro-commercial-components?region=nac; DESCRIPTION: Bipolar Transistors - BJT 200mA 40V; HEIGHT: 1.2mm; MANUFACTURER_NAME: Micro Commercial Components (MCC); MANUFACTURER_PART_NUMBER: MMDT3904-TP; MOUSER_PART_NUMBER: 833-MMDT3904-TP; MOUSER_PRICE-STOCK: https://www.mouser.co.uk/ProductDetail/Micro-Commercial-Components-MCC/MMDT3904-TP?qs=O2qRfqcg9D%252BXS9Ak8w1VHA%3D%3D
IC7 = W25Q128JVPIQ:W25Q128JVPIQ: IC FLASH 128M SPI 133MHZ 8WSON Source: Datasheet <https://www.arrow.com/en/products/w25q128jvpiq/winbond-electronics>; ARROW_PART_NUMBER: W25Q128JVPIQ; ARROW_PRICE-STOCK: https://www.arrow.com/en/products/w25q128jvpiq/winbond-electronics?region=nac; DESCRIPTION: IC FLASH 128M SPI 133MHZ 8WSON; HEIGHT: 0.8mm; MANUFACTURER_NAME: Winbond; MANUFACTURER_PART_NUMBER: W25Q128JVPIQ; MOUSER_PART_NUMBER: 454-W25Q128JVPIQ; MOUSER_PRICE-STOCK: https://www.mouser.co.uk/ProductDetail/Winbond/W25Q128JVPIQ?qs=qSfuJ%252Bfl%2Fd676hAD%252B1JSfw%3D%3D
IC8 = CD74HC4067SM96:CD74HC4067SM96: High Speed CMOS 16-Ch MUX/DEMUX 24P SOIC CD74HC4067SM96, Multiplexer/Demultiplexer Single 16:1, 3 V, 5 V, 24-Pin, SSOP, 1 Source: Datasheet <https://datasheet.datasheetarchive.com/originals/distributors/SFDatasheet-6/sf-000127204.pdf>; ARROW_PART_NUMBER: CD74HC4067SM96; ARROW_PRICE-STOCK: https://www.arrow.com/en/products/cd74hc4067sm96/texas-instruments?region=nac; DESCRIPTION: High Speed CMOS 16-Ch MUX/DEMUX 24P SOIC CD74HC4067SM96, Multiplexer/Demultiplexer Single 16:1, 3 V, 5 V, 24-Pin, SSOP, 1; HEIGHT: 2mm; MANUFACTURER_NAME: Texas Instruments; MANUFACTURER_PART_NUMBER: CD74HC4067SM96; MOUSER_PART_NUMBER: 595-CD74HC4067SM96; MOUSER_PRICE-STOCK: https://www.mouser.co.uk/ProductDetail/Texas-Instruments/CD74HC4067SM96?qs=JHHQeKcAU3DyfvAOSRLjhQ%3D%3D
IC9 = ESP32-D0WDQ6:ESP32-D0WDQ6: RF System on a Chip - SoC SMD IC ESP32-D0WDQ6, Dual Core MCU, WiFi & Bluetooth Combo, QFN48-pin, 6*6mm Source: Datasheet <https://www.espressif.com/sites/default/files/documentation/esp32_datasheet_en.pdf>; DESCRIPTION: RF System on a Chip - SoC SMD IC ESP32-D0WDQ6, Dual Core MCU, WiFi & Bluetooth Combo, QFN48-pin, 6*6mm; HEIGHT: 0.9mm; MANUFACTURER_NAME: Espressif Systems; MANUFACTURER_PART_NUMBER: ESP32-D0WDQ6; MOUSER_PART_NUMBER: 356-ESP32-D0WDQ6; MOUSER_PRICE-STOCK: https://www.mouser.co.uk/ProductDetail/Espressif-Systems/ESP32-D0WDQ6?qs=chTDxNqvsykWgzfXx0gR%252BQ%3D%3D
IC10 = TB6612FNG_C_8_EL:TB6612FNG,C,8,EL: otor / Motion / Ignition Controllers & Drivers Brush Motor Driver IC Source: Datasheet <http://toshiba.semicon-storage.com/info/docget.jsp?did=10660&prodName=TB6612FNG>; ARROW_PART_NUMBER: TB6612FNG,C,8,EL; ARROW_PRICE-STOCK: https://www.arrow.com/en/products/tb6612fngc8el/toshiba?region=nac; DESCRIPTION: otor / Motion / Ignition Controllers & Drivers Brush Motor Driver IC; HEIGHT: 1.6mm; MANUFACTURER_NAME: Toshiba; MANUFACTURER_PART_NUMBER: TB6612FNG,C,8,EL; MOUSER_PART_NUMBER: 757-TB6612FNGC8EL; MOUSER_PRICE-STOCK: https://www.mouser.co.uk/ProductDetail/Toshiba/TB6612FNGC8EL?qs=rsevcuukUAy2UalRuv4E%2FQ%3D%3D
IC11 = MPU-6050:MPU-6050: Gyro & Accelerometer 6 Axis I2C,MEMs InvenSense MPU-6050 6-Axis Motion Sensor Module Source: Datasheet <http://store.invensense.com/datasheets/invensense/MPU-6050_DataSheet_V3 4.pdf>; ARROW_PART_NUMBER: MPU-6050; ARROW_PRICE-STOCK: https://www.arrow.com/en/products/mpu-6050/invensense; DESCRIPTION: Gyro & Accelerometer 6 Axis I2C,MEMs InvenSense MPU-6050 6-Axis Motion Sensor Module; HEIGHT: 0.95mm; MANUFACTURER_NAME: InvenSense Inc.; MANUFACTURER_PART_NUMBER: MPU-6050; MOUSER_PART_NUMBER: N/A; MOUSER_PRICE-STOCK: http://www.mouser.com/Search/ProductDetail.aspx?qs=u4fy%2fsgLU9O14B5JgyQFvg%3d%3d
IC13 IC15 = 74HC595PW_118:74HC595PW,118: 74HC(T)595 - 8-bit serial-in, serial or parallel-out shift register with output latches; 3-state@en-us Source: Datasheet <https://assets.nexperia.com/documents/data-sheet/74HC_HCT595.pdf>; ARROW_PART_NUMBER: 74HC595PW,118; ARROW_PRICE-STOCK: https://www.arrow.com/en/products/74hc595pw118/nexperia?region=asia; DESCRIPTION: 74HC(T)595 - 8-bit serial-in, serial or parallel-out shift register with output latches; 3-state@en-us; HEIGHT: 1.1mm; MANUFACTURER_NAME: Nexperia; MANUFACTURER_PART_NUMBER: 74HC595PW,118; MOUSER_PART_NUMBER: 771-74HC595PW-T; MOUSER_PRICE-STOCK: https://www.mouser.co.uk/ProductDetail/Nexperia/74HC595PW118?qs=P62ublwmbi8GOYhe4PjE9Q%3D%3D
IC14 = MP1584EN-LF-Z:MP1584EN-LF-Z: Switching Voltage Regulators 3A 1.5MHz 28V Nonsync Buck Source: Datasheet <https://componentsearchengine.com/Datasheets/1/MP1584EN-LF-Z.pdf>; DESCRIPTION: Switching Voltage Regulators 3A 1.5MHz 28V Nonsync Buck; HEIGHT: 1.7mm; MANUFACTURER_NAME: Monolithic Power Systems (MPS); MANUFACTURER_PART_NUMBER: MP1584EN-LF-Z; MOUSER_PART_NUMBER: 946-MP1584ENLFZ; MOUSER_PRICE-STOCK: https://www.mouser.co.uk/ProductDetail/Monolithic-Power-Systems-MPS/MP1584EN-LF-Z?qs=rC7bBWoQAAktQUA%2FYI26vA%3D%3D
IC16 IC17 = HY2213-BB3A:HY2213-BB3A: PMIC - Battery Management SOT-23-6 RoHS Source: Datasheet <https://datasheet.lcsc.com/szlcsc/HYCON-Tech-HY2213-BB3A_C113632.pdf>; DESCRIPTION: PMIC - Battery Management SOT-23-6 RoHS; HEIGHT: 1.4mm; MANUFACTURER_NAME: Hycon; MANUFACTURER_PART_NUMBER: HY2213-BB3A
IC18 = Eigene Library:CN3302
IC19 = HY2120-CB:HY2120-CB: Battery Protection ICs SOT-23-6 RoHS Source: Datasheet <https://datasheet.lcsc.com/szlcsc/HYCON-Tech-HY2120CB_C116509.pdf>; DESCRIPTION: Battery Protection ICs SOT-23-6 RoHS; HEIGHT: 1.4mm; MANUFACTURER_NAME: Hycon; MANUFACTURER_PART_NUMBER: HY2120-CB
J1 = 5-1814832-2:5-1814832-2: RF Connectors, SMA RF Interface, Jack, RF Connector Mated Outer Diameter (Approximate) .25 in [6.35 mm], 50 , Threaded, 3GHz Operating Frequency Source: Datasheet <https://www.te.com/commerce/DocumentDelivery/DDEController?Action=showdoc&DocId=Customer Drawing1814832CpdfEnglishENG_CD_1814832_C.pdf5-1814832-2>; ARROW_PART_NUMBER: 5-1814832-2; ARROW_PRICE-STOCK: https://www.arrow.com/en/products/5-1814832-2/te-connectivity?region=europe; DESCRIPTION: RF Connectors, SMA RF Interface, Jack, RF Connector Mated Outer Diameter (Approximate) .25 in [6.35 mm], 50 , Threaded, 3GHz Operating Frequency; HEIGHT: 9.5mm; MANUFACTURER_NAME: TE Connectivity; MANUFACTURER_PART_NUMBER: 5-1814832-2; MOUSER_PART_NUMBER: 571-5-1814832-2; MOUSER_PRICE-STOCK: https://www.mouser.co.uk/ProductDetail/TE-Connectivity/5-1814832-2?qs=Cb2nCFKsA8rPOrkEMAAQ4A%3D%3D
J2 = Eigene Library:XT_30
J3 = Eigene Library:2SBALANCER
JP1 JP11 JP12 = pinhead:PINHD-2X3: PIN HEADER
JP2-JP4 = pinhead:PINHD-1X6: PIN HEADER
JP5 JP6 = pinhead:PINHD-1X3: PIN HEADER
JP8-JP10 = SparkFun-Jumpers:JUMPER-SMT_2_NO: Normally open jumper This jumper has two pads in close proximity to each other. Apply solder to close the connection. Round pads are easier to solder for beginners, but are a lot larger. SparkFun Product that uses the round pads: SparkFun EL Sequencer <https://www.sparkfun.com/products/12781>
L1 = SLF12575T-101M1R9-PF:SLF12575T-101M1R9-PF: SMD / SMT Inductors (Coils), L=100?H, L x W x T : Source: Datasheet <https://product.tdk.com/system/files/dam/doc/product/inductor/inductor/smd/catalog/inductor_commercial_power_slf12575_en.pdf>; ARROW_PART_NUMBER: SLF12575T-101M1R9-PF; ARROW_PRICE-STOCK: https://www.arrow.com/en/products/slf12575t-101m1r9-pf/tdk; DESCRIPTION: SMD / SMT Inductors (Coils), L=100?H, L x W x T :; HEIGHT: mm; MANUFACTURER_NAME: TDK; MANUFACTURER_PART_NUMBER: SLF12575T-101M1R9-PF; MOUSER_PART_NUMBER: 810-SLF12575T-101M; MOUSER_PRICE-STOCK: https://www.mouser.co.uk/ProductDetail/TDK/SLF12575T-101M1R9-PF?qs=VpQJLEvtbIYoNWgTZeTebQ%3D%3D
L2 = SMD-3225_4P16MHZ_20PF_10PPM_-4:SMD-3225_4P16MHZ_20PF_10PPM_-4: SMD-3225_4P16MHZ 20PF 10PPM -40~+85 Source: Datasheet <https://datasheet.lcsc.com/szlcsc/Zhejiang-Abel-Elec-SMD-3225-4P-16MHz-20pF-10ppm-40-85_C164049.pdf>; DESCRIPTION: SMD-3225_4P16MHZ 20PF 10PPM -40~+85; HEIGHT: 0.8mm; MANUFACTURER_NAME: TAE(Zhejiang Abel Elec); MANUFACTURER_PART_NUMBER: SMD-3225_4P16MHZ 20PF 10PPM -40~+85℃
L3 = MDA7050-4R7M:MDA7050-4R7M: https://www.lcsc.com/product-detail/Inductors-SMD_KOHERelec-MDA7050-4R7M_C2847541.html 8.8A 4.7uH ±20% 8.8A 20.8mΩ SMD,7.3x6.6x4.8mm Inductors (SMD) ROHS
L4 = LQH5BPB100MT0L:LQH5BPB100MT0L: LQH5BPB_T0 Series Inductor 10uH +/-20% 2020 (5050) Source: Datasheet <https://psearch.en.murata.com/inductor/product/LQH5BPB100MT0#.html>; DESCRIPTION: LQH5BPB_T0 Series Inductor 10uH +/-20% 2020 (5050); HEIGHT: 2.2mm; MANUFACTURER_NAME: Murata Electronics; MANUFACTURER_PART_NUMBER: LQH5BPB100MT0L; MOUSER_PART_NUMBER: 81-LQH5BPB100MT0L; MOUSER_PRICE-STOCK: https://www.mouser.co.uk/ProductDetail/Murata-Electronics/LQH5BPB100MT0L?qs=hNud%2FORuBR2eSUAobsF5Ww%3D%3D
LED1 LED2 = Led:LED: LED OSRAM: - CHIPLED LG R971, LG N971, LY N971, LG Q971, LY Q971, LO R971, LY R971 LH N974, LH R974 LS Q976, LO Q976, LY Q976 LO Q996 - Hyper CHIPLED LW Q18S LB Q993, LB Q99A, LB R99A - SideLED LS A670, LO A670, LY A670, LG A670, LP A670 LB A673, LV A673, LT A673, LW A673 LH A674 LY A675 LS A676, LA A676, LO A676, LY A676, LW A676 LS A679, LY A679, LG A679 - Hyper Micro SIDELED® LS Y876, LA Y876, LO Y876, LY Y876 LT Y87S - SmartLED LW L88C, LW L88S LB L89C, LB L89S, LG L890 LS L89K, LO L89K, LY L89K LS L896, LA L896, LO L896, LY L896 - TOPLED LS T670, LO T670, LY T670, LG T670, LP T670 LSG T670, LSP T670, LSY T670, LOP T670, LYG T670 LG T671, LOG T671, LSG T671 LB T673, LV T673, LT T673, LW T673 LH T674 LS T676, LA T676, LO T676, LY T676, LB T676, LH T676, LSB T676, LW T676 LB T67C, LV T67C, LT T67C, LS T67K, LO T67K, LY T67K, LW E67C LS E67B, LA E67B, LO E67B, LY E67B, LB E67C, LV E67C, LT E67C LW T67C LS T679, LY T679, LG T679 LS T770, LO T770, LY T770, LG T770, LP T770 LB T773, LV T773, LT T773, LW T773 LH T774 LS E675, LA E675, LY E675, LS T675 LS T776, LA T776, LO T776, LY T776, LB T776 LHGB T686 LT T68C, LB T68C - Hyper Mini TOPLED® LB M676 - Mini TOPLED Santana® LG M470 LS M47K, LO M47K, LY M47K Source: http://www.osram.convergy.de LUXEON: - LUMILED® LXK2-PW12-R00, LXK2-PW12-S00, LXK2-PW14-U00, LXK2-PW14-V00 LXK2-PM12-R00, LXK2-PM12-S00, LXK2-PM14-U00 LXK2-PE12-Q00, LXK2-PE12-R00, LXK2-PE12-S00, LXK2-PE14-T00, LXK2-PE14-U00 LXK2-PB12-K00, LXK2-PB12-L00, LXK2-PB12-M00, LXK2-PB14-N00, LXK2-PB14-P00, LXK2-PB14-Q00 LXK2-PR12-L00, LXK2-PR12-M00, LXK2-PR14-Q00, LXK2-PR14-R00 LXK2-PD12-Q00, LXK2-PD12-R00, LXK2-PD12-S00 LXK2-PH12-R00, LXK2-PH12-S00 LXK2-PL12-P00, LXK2-PL12-Q00, LXK2-PL12-R00 Source: www.luxeon.com KINGBRIGHT: KA-3528ASYC Source: www.kingbright.com
LED3-LED9 = led:LED: LED OSRAM: - CHIPLED LG R971, LG N971, LY N971, LG Q971, LY Q971, LO R971, LY R971 LH N974, LH R974 LS Q976, LO Q976, LY Q976 LO Q996 - Hyper CHIPLED LW Q18S LB Q993, LB Q99A, LB R99A - SideLED LS A670, LO A670, LY A670, LG A670, LP A670 LB A673, LV A673, LT A673, LW A673 LH A674 LY A675 LS A676, LA A676, LO A676, LY A676, LW A676 LS A679, LY A679, LG A679 - Hyper Micro SIDELED® LS Y876, LA Y876, LO Y876, LY Y876 LT Y87S - SmartLED LW L88C, LW L88S LB L89C, LB L89S, LG L890 LS L89K, LO L89K, LY L89K LS L896, LA L896, LO L896, LY L896 - TOPLED LS T670, LO T670, LY T670, LG T670, LP T670 LSG T670, LSP T670, LSY T670, LOP T670, LYG T670 LG T671, LOG T671, LSG T671 LB T673, LV T673, LT T673, LW T673 LH T674 LS T676, LA T676, LO T676, LY T676, LB T676, LH T676, LSB T676, LW T676 LB T67C, LV T67C, LT T67C, LS T67K, LO T67K, LY T67K, LW E67C LS E67B, LA E67B, LO E67B, LY E67B, LB E67C, LV E67C, LT E67C LW T67C LS T679, LY T679, LG T679 LS T770, LO T770, LY T770, LG T770, LP T770 LB T773, LV T773, LT T773, LW T773 LH T774 LS E675, LA E675, LY E675, LS T675 LS T776, LA T776, LO T776, LY T776, LB T776 LHGB T686 LT T68C, LB T68C - Hyper Mini TOPLED® LB M676 - Mini TOPLED Santana® LG M470 LS M47K, LO M47K, LY M47K Source: http://www.osram.convergy.de LUXEON: - LUMILED® LXK2-PW12-R00, LXK2-PW12-S00, LXK2-PW14-U00, LXK2-PW14-V00 LXK2-PM12-R00, LXK2-PM12-S00, LXK2-PM14-U00 LXK2-PE12-Q00, LXK2-PE12-R00, LXK2-PE12-S00, LXK2-PE14-T00, LXK2-PE14-U00 LXK2-PB12-K00, LXK2-PB12-L00, LXK2-PB12-M00, LXK2-PB14-N00, LXK2-PB14-P00, LXK2-PB14-Q00 LXK2-PR12-L00, LXK2-PR12-M00, LXK2-PR14-Q00, LXK2-PR14-R00 LXK2-PD12-Q00, LXK2-PD12-R00, LXK2-PD12-S00 LXK2-PH12-R00, LXK2-PH12-S00 LXK2-PL12-P00, LXK2-PL12-Q00, LXK2-PL12-R00 Source: www.luxeon.com KINGBRIGHT: KA-3528ASYC Source: www.kingbright.com
LS1 = CMT-7525-80-SMT-TR:CMT-7525-80-SMT-TR: CMT-7525-80-SMT-TR Check prices <https://pricing.snapeda.com/parts/CMT-7525-80-SMT-TR/CUI%20Devices/view-part?ref=eda>; AVAILABILITY: Good; CUI_PURCHASE_URL: https://www.cuidevices.com/product/audio/buzzers/audio-transducers/cmt-7525-80-smt-tr?utm_source=snapeda.com&utm_medium=referral&utm_campaign=snapedaBOM; DESCRIPTION: 7.5 mm, 3.6 Vo-p, 80 dB, Surface Mount (SMT), Magnetic Audio Transducer Buzzer; MF: CUI Devices; MP: CMT-7525-80-SMT-TR; PACKAGE: CUI Devices; PRICE: None; PURCHASE-URL: https://pricing.snapeda.com/search/part/CMT-7525-80-SMT-TR/?ref=eda
M1-M4 = Eigene Library:MOTOR_30RPM
Q1-Q6 Q8 Q9 = Eigene Library:PT17-21C/L41/TR8
Q7 Q12 Q16 Q21 = SI2302DDS-T1-GE3:SI2302DDS-T1-GE3: SI2302DDS-T1-GE3 N-Channel MOSFET, 2.6 A, 20 V, 3-Pin SOT-363 Vishay Source: Datasheet <http://www.vishay.com/docs/63653/si2302dds.pdf>; ARROW_PART_NUMBER: SI2302DDS-T1-GE3; ARROW_PRICE-STOCK: https://www.arrow.com/en/products/si2302dds-t1-ge3/vishay; DESCRIPTION: SI2302DDS-T1-GE3 N-Channel MOSFET, 2.6 A, 20 V, 3-Pin SOT-363 Vishay; HEIGHT: 1.12mm; MANUFACTURER_NAME: Vishay; MANUFACTURER_PART_NUMBER: SI2302DDS-T1-GE3; MOUSER_PART_NUMBER: 78-SI2302DDS-T1-GE3; MOUSER_PRICE-STOCK: https://www.mouser.co.uk/ProductDetail/Vishay-Semiconductors/SI2302DDS-T1-GE3?qs=MxnWX8BLHKdaCSNWhg%252BxLA%3D%3D
Q10 Q13 = MMBT3904:MMBT3904: Transistor GP BJT NPN 40V 0.2A SOT23 Fairchild MMBT3904 NPN Bipolar Transistor, 0.2 A, 40 V, 3-Pin SOT-23 Source: Datasheet <https://media.digikey.com/pdf/Data Sheets/ON Semiconductor PDFs/2N3904,MMBT3904,PZT3904.pdf>; ARROW_PART_NUMBER: MMBT3904; ARROW_PRICE-STOCK: https://www.arrow.com/en/products/mmbt3904/on-semiconductor; DESCRIPTION: Transistor GP BJT NPN 40V 0.2A SOT23 Fairchild MMBT3904 NPN Bipolar Transistor, 0.2 A, 40 V, 3-Pin SOT-23; HEIGHT: 1.2mm; MANUFACTURER_NAME: ON Semiconductor; MANUFACTURER_PART_NUMBER: MMBT3904; MOUSER_PART_NUMBER: 512-MMBT3904; MOUSER_PRICE-STOCK: https://www.mouser.co.uk/ProductDetail/ON-Semiconductor-Fairchild/MMBT3904?qs=UMEuL5FsraCg3xKjS4uBJQ%3D%3D
Q11 = IRF7416TRPBF:IRF7416TRPBF: INFINEON - IRF7416TRPBF - MOSFET Transistor, P Channel, 10 A, 30 V, 0.02 ohm, 10 V, 2.04 V Source: Datasheet <https://componentsearchengine.com/Datasheets/2/IRF7416TRPBF.pdf>; ARROW_PART_NUMBER: IRF7416TRPBF; ARROW_PRICE-STOCK: https://www.arrow.com/en/products/irf7416trpbf/infineon-technologies-ag?region=nac; DESCRIPTION: INFINEON - IRF7416TRPBF - MOSFET Transistor, P Channel, 10 A, 30 V, 0.02 ohm, 10 V, 2.04 V; HEIGHT: 1.75mm; MANUFACTURER_NAME: Infineon; MANUFACTURER_PART_NUMBER: IRF7416TRPBF; MOUSER_PART_NUMBER: 942-IRF7416TRPBF; MOUSER_PRICE-STOCK: https://www.mouser.co.uk/ProductDetail/Infineon-Technologies/IRF7416TRPBF?qs=9%252BKlkBgLFf1tuhXoEVAcyA%3D%3D
Q14 Q15 = FSS2302SA2SHB:FSS2302SA2SHB: MOSFET P-CH 30V 4.3A SOT23 Source: Datasheet <http://www.aosmd.com/pdfs/datasheet/ao3407a.pdf>; ARROW_PART_NUMBER: AO3407A; ARROW_PRICE-STOCK: https://www.arrow.com/en/products/ao3407a/alpha-and-omega-semiconductor; DESCRIPTION: MOSFET P-CH 30V 4.3A SOT23; HEIGHT: 1.25mm; MANUFACTURER_NAME: Alpha & Omega Semiconductors; MANUFACTURER_PART_NUMBER: AO3407A
Q17 = AO3407A:AO3407A: MOSFET P-CH 30V 4.3A SOT23 Source: Datasheet <http://www.aosmd.com/pdfs/datasheet/ao3407a.pdf>; ARROW_PART_NUMBER: AO3407A; ARROW_PRICE-STOCK: https://www.arrow.com/en/products/ao3407a/alpha-and-omega-semiconductor; DESCRIPTION: MOSFET P-CH 30V 4.3A SOT23; HEIGHT: 1.25mm; MANUFACTURER_NAME: Alpha & Omega Semiconductors; MANUFACTURER_PART_NUMBER: AO3407A
Q18 Q20 = AO4406AL:AO4406AL: N-Channel 30V 13A (Tc) 3.1W (Tc) Surface Mount 8-SOIC Source: Datasheet <https://datasheet.lcsc.com/szlcsc/Alpha-Omega-Semicon-AOS-AO4406AL_C35349.pdf>; DESCRIPTION: N-Channel 30V 13A (Tc) 3.1W (Tc) Surface Mount 8-SOIC; HEIGHT: 1.75mm; MANUFACTURER_NAME: Alpha & Omega Semiconductors; MANUFACTURER_PART_NUMBER: AO4406AL
Q19 = AO4468:AO4468: MOSFET N-Channel 30V 10.5A (Ta) 3.1W (Ta) Surface Mount 8-SOIC Source: Datasheet <http://aosmd.com/res/data_sheets/AO4468.pdf>; ARROW_PART_NUMBER: AO4468; ARROW_PRICE-STOCK: https://www.arrow.com/en/products/ao4468/alpha-and-omega-semiconductor?region=nac; DESCRIPTION: MOSFET N-Channel 30V 10.5A (Ta) 3.1W (Ta) Surface Mount 8-SOIC; HEIGHT: 1.75mm; MANUFACTURER_NAME: Alpha & Omega Semiconductors; MANUFACTURER_PART_NUMBER: AO4468
R1-R77 = rc-master-smd:R_: RESISTOR
RE1 = PEC12R-4230F-S0024:PEC12R-4230F-S0024: Encoder 30mm Shaft w/Switch 24 pulses Bourns 24 Pulse Incremental Mechanical Rotary Encoder with a 6 mm Flat Shaft, Through Hole Source: Datasheet <http://www.bourns.com/data/global/pdfs/PEC12R.pdf>; ARROW_PART_NUMBER: PEC12R-4230F-S0024; ARROW_PRICE-STOCK: https://www.arrow.com/en/products/pec12r-4230f-s0024/bourns?region=nac; DESCRIPTION: Encoder 30mm Shaft w/Switch 24 pulses Bourns 24 Pulse Incremental Mechanical Rotary Encoder with a 6 mm Flat Shaft, Through Hole; HEIGHT: 30.5mm; MANUFACTURER_NAME: Bourns; MANUFACTURER_PART_NUMBER: PEC12R-4230F-S0024; MOUSER_PART_NUMBER: 652-PEC12R-4230F-S24; MOUSER_PRICE-STOCK: https://www.mouser.co.uk/ProductDetail/Bourns/PEC12R-4230F-S0024?qs=Zq5ylnUbLm78S3yGzO6hng%3D%3D
RGB1 RGB2 = RGB LED:RGBLED
S1 = B3S-1002P:B3S-1002P: OMRON ELECTRONIC COMPONENTS - B3S-1002P - SWITCH, TACTILE, SPST-NO, 50mA, SMD, FULL REEL Source: Datasheet <https://componentsearchengine.com/Datasheets/1/B3S-1002P.pdf>; ARROW_PART_NUMBER: B3S-1002P; ARROW_PRICE-STOCK: https://www.arrow.com/en/products/b3s1002p/omron; DESCRIPTION: OMRON ELECTRONIC COMPONENTS - B3S-1002P - SWITCH, TACTILE, SPST-NO, 50mA, SMD, FULL REEL; HEIGHT: 4.3mm; MANUFACTURER_NAME: Omron Electronics; MANUFACTURER_PART_NUMBER: B3S-1002P; MOUSER_PART_NUMBER: 653-B3S-1002P; MOUSER_PRICE-STOCK: https://www.mouser.co.uk/ProductDetail/Omron-Electronics/B3S-1002P?qs=VO24nqdQNUCtpi6pYm2hHQ%3D%3D
TP1-TP12 = SparkFun-Connectors:TEST-POINT: SparkFun Test Points Bare copper test points for troubleshooting or In-Circuit-Testing. These are used by our Production team for verifying production board runs using pogo-pins on test beds. SparkFun Products: SparkFun LSM9DS1 Breakout <https://www.sparkfun.com/products/13284> SparkFun PSOC <https://www.sparkfun.com/products/13714> SparkFun Load Cell Amplifier <https://www.sparkfun.com/products/13879>
U1 = TYPE-C-31-M-12:TYPE-C-31-M-14; BUILT_BY: EMA_Cory; COPYRIGHT: Copyright (C) 2018 Accelerated Designs. All rights reserved; DATASHEET: https://datasheet.lcsc.com/szlcsc/1811101526_Korean-Hroparts-Elec-TYPE-C-31-M-14_C223907.pdf; MANUFACTURER_PART_NUMBER: TYPE-C-31-M-14; SOURCELIBRARY: HRO_Parts_Electronics_2020-03-18; VENDOR: HRO Electronics
U2 U3 = TCS34725FN:TCS34725FN: Colour Light to Digital Converter DFN6 ams TCS34725FN Ambient Light Sensor Unit Surface Mount 6-Pin DFN Source: Datasheet <https://datasheet.datasheetarchive.com/originals/distributors/DKDS-7/120564.pdf>; ARROW_PART_NUMBER: TCS34725FN; ARROW_PRICE-STOCK: https://www.arrow.com/en/products/tcs34725fn/ams-ag?region=nac; DESCRIPTION: Colour Light to Digital Converter DFN6 ams TCS34725FN Ambient Light Sensor Unit Surface Mount 6-Pin DFN; HEIGHT: mm; MANUFACTURER_NAME: ams; MANUFACTURER_PART_NUMBER: TCS34725FN; MOUSER_PART_NUMBER: 985-TCS34725FN; MOUSER_PRICE-STOCK: https://www.mouser.co.uk/ProductDetail/ams/TCS34725FN?qs=ECv0MKUHA8HkCOWi8XoeIw%3D%3D